# Altium schematic sheet remote_P1.schdoc
size 297 x 209 mm; Symbol: Drawing-Symbol_A4; @Project Name: Sonat_suport_mainboard; @Page Count: 1; @Update Date: 2026-11-01; @Create Date: 2026-11-01; @Schematic Name: Schematic2; @Page No: 1; @Page Name: P1; Company: EasyEDA.com; Version: V1.0; Page Size: A4; Device: Drawing-Symbol_A4; @Create Time: 14:49:21; @Update Time: 14:49:21; Border: 1; Width: 1170; Height: 825; Region Start: 1; X Region Count: 6; Y Region Count: 4; Blade Width: 10; Title Block Position: 3
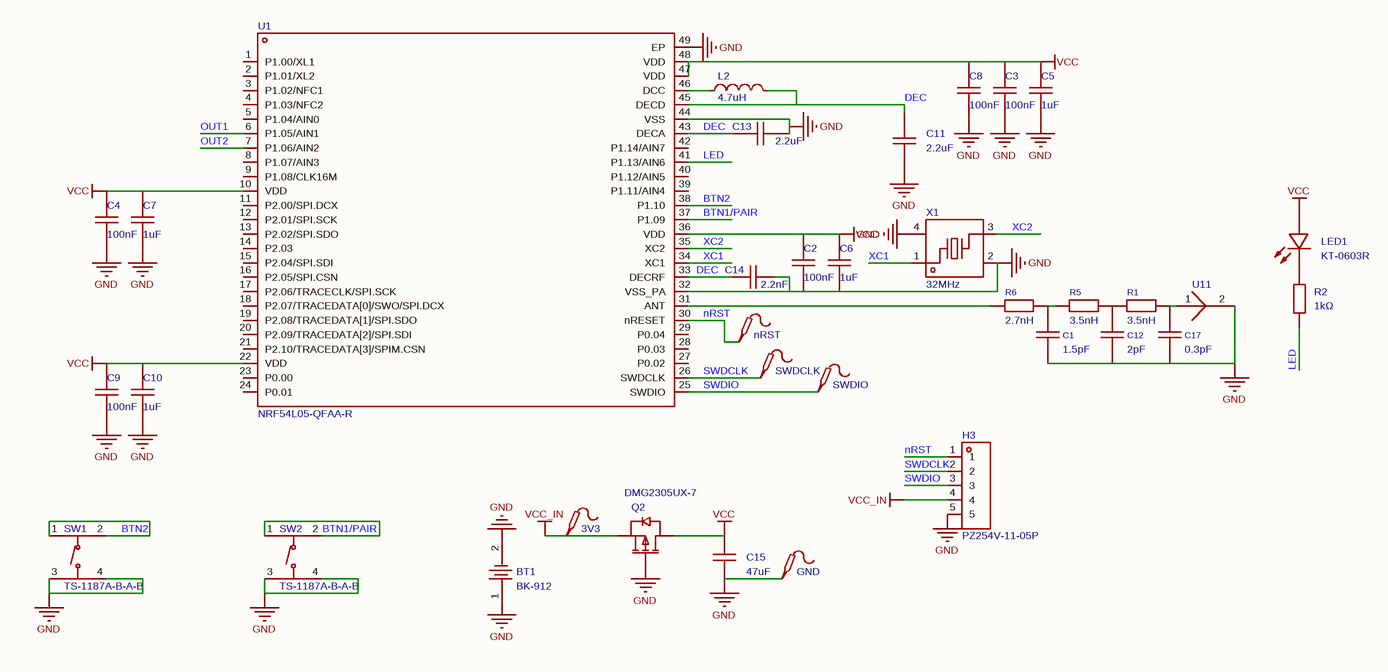
[diagram p0: remote_P1.schdoc]

## Parts
3V3  (no value)  [Test-Point-0.5mm]
BT1  BK-912  [BAT-SMD_BK-912-TR]
C1  1.5pF  [C0402]
C2  100nF  [C0402]
C3  100nF  [C0402]
C4  100nF  [C0402]
C5  1uF  [C0402]
C6  1uF  [C0402]
C7  1uF  [C0402]
C8  100nF  [C0402]
C9  100nF  [C0402]
C10  1uF  [C0402]
C11  2.2uF  [C0402]
C12  2pF  [C0402]
C13  2.2uF  [C0402]
C14  2.2nF  [C0402]
C15  47uF  [C0805]
C17  0.3pF  [C0402]
GND  (no value)  [Test-Point-0.5mm]
H3  PZ254V-11-05P  [HDR-TH_5P-P2.54-V-M]
L2  4.7uH  [L0805]
LED1  KT-0603R  [LED-SMD_L1.6-W0.8-R-RD]
nRST  (no value)  [Test-Point-0.5mm]
Q2  DMG2305UX-7  [SOT-23-3_L2.9-W1.3-P1.90-LS2.4-BR]
R1  3.5nH  [R0402]
R2  1kΩ  [R0402]
R5  3.5nH  [R0402]
R6  2.7nH  [R0402]
SW1  TS-1187A-B-A-B  [SW-SMD_4P-L5.1-W5.1-P3.70-LS6.5-TL_H1.5]
SW2  TS-1187A-B-A-B  [SW-SMD_4P-L5.1-W5.1-P3.70-LS6.5-TL_H1.5]
SWDCLK  (no value)  [Test-Point-0.5mm]
SWDIO  (no value)  [Test-Point-0.5mm]
U1  NRF54L05-QFAA-R  [QFN-48_L6.0-W6.0-P0.40-TL-EP4.6]
U11  (no value)  [Texas_SWRA117D_2.4GHz_Right]
X1  32MHz  [CRYSTAL-SMD_4P-L2.0-W1.6-BL-2]

## Nets
GND: BT1.1 BT1.2 C1.1 C2.1 C3.1 C4.1 C5.1 C6.1 C7.1 C8.1 C9.1 C10.1 C11.1 C12.1 C13.1 C14.2 C15.1 C17.1 GND.1 H3.5 Q2.1(G) SW1.3(C) SW1.4(D) SW2.3(C) SW2.4(D) U1.32(VSS_PA) U1.44(VSS) U1.49(EP) U11.2 X1.2(GND) X1.4(GND)
VCC: C2.2 C3.2 C4.2 C5.2 C6.2 C7.2 C8.2 C9.2 C10.2 C15.2 LED1.1(A) Q2.3(D) U1.10(VDD) U1.22(VDD) U1.36(VDD) U1.47(VDD) U1.48(VDD)
VCC_IN: 3V3.1 H3.4 Q2.2(S)
BTN1/PAIR: SW2.1(A) SW2.2(B) U1.37(P1.09)
BTN2: SW1.1(A) SW1.2(B) U1.38(P1.10)
DEC: C11.2 C13.2 C14.1 L2.2 U1.33(DECRF) U1.43(DECA) U1.45(DECD)
LED: R2.1 U1.41(P1.13/AIN6)
nRST: H3.1 nRST.1 U1.30(nRESET)
OUT1: U1.6(P1.05/AIN1)
OUT2: U1.7(P1.06/AIN2)
SWDCLK: H3.2 SWDCLK.1 U1.26(SWDCLK)
SWDIO: H3.3 SWDIO.1 U1.25(SWDIO)
XC1: U1.34(XC1) X1.1
XC2: U1.35(XC2) X1.3
NetC1_2: C1.2 R5.1 R6.2
NetC12_2: C12.2 R1.1 R5.2
NetC17_2: C17.2 R1.2 U11.1
NetL2_1: L2.1 U1.46(DCC)
NetLED1_2: LED1.2(K) R2.2
NetR6_1: R6.1 U1.31(ANT)

Not connected (* = marked no-connect by the designer): U1 1(P1.00/XL1) 2(P1.01/XL2) 3(P1.02/NFC1) 4(P1.03/NFC2) 5(P1.04/AIN0) 8(P1.07/AIN3) 9(P1.08/CLK16M) 11(P2.00/SPI.DCX) 12(P2.01/SPI.SCK) 13(P2.02/SPI.SDO) 14(P2.03) 15(P2.04/SPI.SDI) 16(P2.05/SPI.CSN) 17(P2.06/TRACECLK/SPI.SCK) 18(P2.07/TRACEDATA[0]/SWO/SPI.DCX) 19(P2.08/TRACEDATA[1]/SPI.SDO) 20(P2.09/TRACEDATA[2]/SPI.SDI) 21(P2.10/TRACEDATA[3]/SPIM.CSN) 23(P0.00) 24(P0.01) 27(P0.02) 28(P0.03) 29(P0.04) 39(P1.11/AIN4) 40(P1.12/AIN5) 42(P1.14/AIN7)

## Notes on the sheet
- Create at
- 2026-11-01
- Schematic
- Board
- Schematic2
- Update at
- Page
- P1
- Drawn
- Reviewed
- Sonat_suport_mainboard
- Version
- V1.0
- Size
- A4
- Page  1  Total  1
- EasyEDA.com

## Library data of the parts
3V3 GND nRST SWDCLK SWDIO = Test-Point: Test Point 测试点; AddInBom: yes; Symbol: Test-Point; Device: Test-Point; ConvertToPcb: yes; FootprintName: Test-Point-0.5mm
BT1 = BK-912: Manufacturer: MPD(Memory Protection Devices); Add into BOM: no; ConvertToPcb: yes; ModelId: 6822e3e2a36e44d0990b2b6a441ccfdd|0819f05c4eef4c71ace90d822a990e87; ModelTransform: 899.9982,606.958,0,0,0,0,0,3.11,0; Symbol: BK-912; Device: BK-912; LCSC Part Name: BK-912; SupplierPart: C5369339; ManufacturerPart: BK-912; Supplier Footprint: -; JLCPCB Part Class: Extended Part; Datasheet: https://item.szlcsc.com/datasheet/BK-912/6212042.html; Supplier: LCSC; FootprintName: BAT-SMD_BK-912-TR; ModelName: BAT-SMD_BK-912-TR
C1 C12 C17 = GRM1555C1H1R2WA01D: Capacitance:1.2pF Voltage Rating:50V Temperature Coefficient:C0G; Manufacturer: muRata(村田); AddInBom: yes; ModelId: b7d13df3e9464d7a99d0651d1a5b4d57|0819f05c4eef4c71ace90d822a990e87; ModelName: C0402_L1.0-W0.5-H0.5; ModelTransform: 39.37,19.685,0,0,0,0,0,0,0; Voltage Rating: 50V; Temperature Coefficient: C0G; Symbol: GRM1555C1H1R2WA01D; Device: GRM1555C1H1R2WA01D; Supplier: LCSC; Manufacturer Part: GRM1555C1H1R2WA01D; JLCPCB Part Class: Extended Part; LCSC Part Name: ±0.05pF 1.2pF 50V; Supplier Footprint: 0402; Datasheet: https://item.szlcsc.com/datasheet/GRM1555C1H1R2WA01D/90101.html; ConvertToPcb: yes; FootprintName: C0402
  C1: Value: 1.5pF
  C12: Value: 2pF
  C17: Value: 0.3pF
C2-C4 C8 C9 = CL05B104KO5NNNC: Capacitance:100nF Tolerance:±10% Tolerance:±10% Voltage Rating:16V Temperature Coefficient:X7R; Manufacturer: SAMSUNG(三星); AddInBom: yes; ModelId: b7d13df3e9464d7a99d0651d1a5b4d57|0819f05c4eef4c71ace90d822a990e87; ModelName: C0402_L1.0-W0.5-H0.5; ModelTransform: 39.37,19.685,0,0,0,0,0,0,0; Tolerance: ±10%; Voltage Rating: 16V; Temperature Coefficient: X7R; Symbol: CL05B104KO5NNNC; Device: CL05B104KO5NNNC; LCSC Part Name: 100nF ±10% 16V; SupplierPart: C1525; ManufacturerPart: CL05B104KO5NNNC; Supplier Footprint: 0402; JLCPCB Part Class: Basic Part; Datasheet: https://item.szlcsc.com/datasheet/CL05B104KO5NNNC/1877.html; Supplier: LCSC; ConvertToPcb: yes; FootprintName: C0402; Value: 100nF
C5-C7 C10 = CL05A105KA5NQNC: Capacitance:1uF Tolerance:±10% Tolerance:±10% Voltage Rating:25V Temperature Coefficient:X5R; Manufacturer: SAMSUNG(三星); AddInBom: yes; ModelId: b7d13df3e9464d7a99d0651d1a5b4d57|0819f05c4eef4c71ace90d822a990e87; ModelName: C0402_L1.0-W0.5-H0.5; ModelTransform: 39.37,19.685,0,0,0,0,0,0,0; Tolerance: ±10%; Voltage Rating: 25V; Temperature Coefficient: X5R; Symbol: CL05A105KA5NQNC; Device: CL05A105KA5NQNC; LCSC Part Name: 1uF ±10% 25V; SupplierPart: C52923; ManufacturerPart: CL05A105KA5NQNC; Supplier Footprint: 0402; JLCPCB Part Class: Basic Part; Datasheet: https://item.szlcsc.com/datasheet/CL05A105KA5NQNC/53938.html; Supplier: LCSC; ConvertToPcb: yes; FootprintName: C0402; Value: 1uF
C11 C13 = CL05A225MQ5NSNC: Capacitance:2.2uF Tolerance:±20% Tolerance:±20% Voltage Rating:6.3V Temperature Coefficient:X5R; Manufacturer: SAMSUNG(三星); AddInBom: yes; ModelId: b7d13df3e9464d7a99d0651d1a5b4d57|0819f05c4eef4c71ace90d822a990e87; ModelName: C0402_L1.0-W0.5-H0.5; ModelTransform: 39.37,19.685,0,0,0,0,0,0,0; Tolerance: ±20%; Voltage Rating: 6.3V; Temperature Coefficient: X5R; Symbol: CL05A225MQ5NSNC; Device: CL05A225MQ5NSNC; LCSC Part Name: 2.2uF ±20% 6.3V; SupplierPart: C12530; ManufacturerPart: CL05A225MQ5NSNC; Supplier Footprint: 0402; JLCPCB Part Class: Basic Part; Datasheet: https://item.szlcsc.com/datasheet/CL05A225MQ5NSNC/13164.html; Supplier: LCSC; ConvertToPcb: yes; FootprintName: C0402; Value: 2.2uF
C14 = 0402B222K500NT: Capacitance:2.2nF Tolerance:±10% Tolerance:±10% Voltage Rating:50V Temperature Coefficient:X7R; Manufacturer: FH(风华); AddInBom: yes; ModelId: b7d13df3e9464d7a99d0651d1a5b4d57|0819f05c4eef4c71ace90d822a990e87; ModelName: C0402_L1.0-W0.5-H0.5; ModelTransform: 39.37,19.685,0,0,0,0,0,0,0; Tolerance: ±10%; Voltage Rating: 50V; Temperature Coefficient: X7R; Symbol: 0402B222K500NT; Device: 0402B222K500NT; LCSC Part Name: 2.2nF ±10% 50V; SupplierPart: C1531; ManufacturerPart: 0402B222K500NT; Supplier Footprint: 0402; JLCPCB Part Class: Extended Part; Datasheet: https://item.szlcsc.com/datasheet/0402B222K500NT/1883.html; Supplier: LCSC; ConvertToPcb: yes; FootprintName: C0402; Value: 2.2nF
C15 = CL21A476MQYNNNE: Capacitance:47uF Tolerance:±20% Tolerance:±20% Voltage Rating:6.3V Temperature Coefficient:X5R; Manufacturer: SAMSUNG(三星); AddInBom: yes; ModelId: 8c88e81f49c6409b980720ec8953afb6|0819f05c4eef4c71ace90d822a990e87; ModelName: C0805_L2.0-W1.3-H1.3; ModelTransform: 78.74,51.181,0,0,0,0,0,0.0005,0; Tolerance: ±20%; Voltage Rating: 6.3V; Temperature Coefficient: X5R; Symbol: CL21A476MQYNNNE; Device: CL21A476MQYNNNE; LCSC Part Name: 47uF ±20% 6.3V; SupplierPart: C16780; ManufacturerPart: CL21A476MQYNNNE; Supplier Footprint: 0805; JLCPCB Part Class: Basic Part; Datasheet: https://item.szlcsc.com/datasheet/CL21A476MQYNNNE/17464.html; Supplier: LCSC; ConvertToPcb: yes; FootprintName: C0805; Value: 47uF
H3 = PZ254V-11-05P: Pin Structure:1x5P Pitch:2.54mm Row Spacing:- Circluar Pins/Square Pins:Square pin Mounting Type:Through Hole Number of Rows:1 Number of Pins:5P Current Rating:3A Voltage Rating (Max):250V Length of Mating Pin:6.1mm Insulation Height:2.5mm Length of End C; Manufacturer: XFCN(兴飞); Add into BOM: no; ConvertToPcb: yes; ModelId: 98c612b43cbb479a86eae3328ff22ecc|0819f05c4eef4c71ace90d822a990e87; ModelName: HDR-TH_5P-P2.54-M-LI-1X5P; ModelTransform: 499.999,100,0,0,0,0,0,0,-118.11; Pin Structure: 1x5P; Pitch: 2.54mm; Current Rating: 3A; Voltage Rating (Max): 250V; Symbol: PZ254V-11-05P; Device: PZ254V-11-05P; LCSC Part Name: 1x5P 间距:2.54mm 方针 直插; SupplierPart: C492404; ManufacturerPart: PZ254V-11-05P; Supplier Footprint: 插件,P=2.54mm; JLCPCB Part Class: Extended Part; Datasheet: https://item.szlcsc.com/datasheet/PZ254V-11-05P/502960.html; Supplier: LCSC; FootprintName: HDR-TH_5P-P2.54-V-M; Row Spacing: -; Circluar Pins/Square Pins: Square pin; Mounting Type: Through Hole; Number of Rows: 1; Number of Pins: 5P; Length of Mating Pin: 6.1mm; Insulation Height: 2.5mm; Length of End Connection Pin: 3mm; Contact Material: Brass; Contact Plating: Gold; Operating Temperature: -40℃~+105℃; Color: Black
L2 = CB2012T4R7M: Inductance:4.7uH Tolerance:±20% Tolerance:±20% Current Rating:580mA Current - Saturation(Isat):300mA DC Resistance(DCR):520mΩ Type:Wire-wound inductor; Manufacturer: TAIYO YUDEN(太诱); AddInBom: yes; ModelId: b83c7c5430874b8eb2319a65d9433429|0819f05c4eef4c71ace90d822a990e87; ModelName: R0805_L2.0-W1.3-H0.6; ModelTransform: 78.74,51.181,0,0,0,0,0,0.001,0; Tolerance: ±20%; Current Rating: 580mA; Current - Saturation(Isat): 300mA; DC Resistance(DCR): 520mΩ; Symbol: CB2012T4R7M; Device: CB2012T4R7M; LCSC Part Name: 4.7uH ±20% 300mA; SupplierPart: C90313; ManufacturerPart: CB2012T4R7M; Supplier Footprint: 0805; JLCPCB Part Class: Extended Part; Datasheet: https://item.szlcsc.com/datasheet/CB2012T4R7M/91499.html; Supplier: LCSC; ConvertToPcb: yes; FootprintName: L0805; Value: 4.7uH; Type: Wire-wound inductor
LED1 = KT-0603R: Lamp Holder Type:1.6mm x 0.8mm square LED Illumination Color:Red Voltage - Forward(Vf):1.8V~2.4V Voltage - Forward(Vf):1.8V~2.4V Power(Watts):40mW Forward Current:20mA Wavelength - Dominant:615nm~630nm Wavelength - Dominant:615nm~630nm Peak Wavelength:645; Manufacturer: KENTO; AddInBom: yes; ModelId: 19cc79473bbc420a8203ad67d1a57d42|0819f05c4eef4c71ace90d822a990e87; ModelName: LED0603_L1.6-W0.8-H0.6; ModelTransform: 63.7794,31.496,0,0,0,0,0,0,0; Illumination Color: Red; Power(Watts): 40mW; Forward Current: 20mA; Peak Wavelength: 645nm; Diode Configuration: Discrete Diode; Lens Color: Water Clear; Luminous Intensity: 300mcd; Viewing Angle: 120°; Symbol: KT-0603R; Device: KT-0603R; LCSC Part Name: 0603 红灯 高亮; SupplierPart: C2286; ManufacturerPart: KT-0603R; Supplier Footprint: 0603; JLCPCB Part Class: Basic Part; Datasheet: https://item.szlcsc.com/datasheet/KT-0603R/2659.html; Supplier: LCSC; ConvertToPcb: yes; FootprintName: LED-SMD_L1.6-W0.8-R-RD; Lamp Holder Type: 1.6mm x 0.8mm square LED; Voltage - Forward(Vf): 1.8V~2.4V; Wavelength - Dominant: 615nm~630nm; Color Temperature: -; Mounting Style: -; Operating Temperature: -40℃~+85℃
Q2 = DMG2305UX-7: Number:1 P-Channel Drain to Source Voltage:20V Current - Continuous Drain(Id):5A RDS(on):52mΩ@4.5V；100mΩ@2.5V Pd - Power Dissipation:1.4W Gate Threshold Voltage (Vgs(th)):900mV Gate Charge(Qg):10.2nC@4.5V Input Capacitance(Ciss):808pF Reverse Transfer Cap; Manufacturer: DIODES(美台); AddInBom: yes; ModelId: 62a57c6760504a01965db6419a6d07df|0819f05c4eef4c71ace90d822a990e87; ModelName: SOT-23-3P_L2.9-W1.3-H1.0-LS2.4-P0.95; ModelTransform: 98.425,114.173,0,180,0,0,0.0005,-0.0005,0; Drain to Source Voltage: 20V; Current - Continuous Drain(Id): 5A; Pd - Power Dissipation: 1.4W; Gate Threshold Voltage (Vgs(th)): 900mV; Input Capacitance(Ciss): 808pF; Reverse Transfer Capacitance (Crss@Vds): 77pF; Output Capacitance(Coss): 85pF; Symbol: DMG2305UX-7; Device: DMG2305UX-7; LCSC Part Name: 1个P沟道 耐压:20V 电流:5A; SupplierPart: C150470; ManufacturerPart: DMG2305UX-7; Supplier Footprint: SOT-23; JLCPCB Part Class: Extended Part; Datasheet: https://item.szlcsc.com/datasheet/DMG2305UX-7/161808.html; Supplier: LCSC; ConvertToPcb: yes; FootprintName: SOT-23-3_L2.9-W1.3-P1.90-LS2.4-BR; Number: 1 P-Channel; RDS(on): 52mΩ@4.5V；100mΩ@2.5V; Gate Charge(Qg): 10.2nC@4.5V; Operating Temperature: -55℃~+150℃; Type: P-Channel
R1 R5 R6 = 0402WGF0000TCE: Type:Thick Film Resistor Resistance:0Ω Tolerance:±1% Tolerance:±1% Power(Watts):62.5mW Voltage-Supply(Max):50V Temperature Coefficient:±800ppm/℃ Temperature Coefficient:±800ppm/℃ Operating Temperature:-55℃~+155℃ Operating Temperature:-55℃~+155℃; Manufacturer: UNI-ROYAL(厚声); AddInBom: yes; ModelId: efdecb7dae4442949d28eecaf748420f|0819f05c4eef4c71ace90d822a990e87; ModelName: R0402_L1.0-W0.5-H0.4; ModelTransform: 39.37,19.685,0,0,0,0,0,0,0; Tolerance: ±1%; Power(Watts): 62.5mW; Voltage-Supply(Max): 50V; Symbol: 0402WGF0000TCE; Device: 0402WGF0000TCE; Supplier: LCSC; Manufacturer Part: 0402WGF0000TCE; JLCPCB Part Class: Basic Part; LCSC Part Name: 厚膜电阻 0Ω ±1%; Supplier Footprint: 0402; Datasheet: https://item.szlcsc.com/datasheet/0402WGF0000TCE/17853.html; ConvertToPcb: yes; FootprintName: R0402; Type: Thick Film Resistor; Temperature Coefficient: ±800ppm/℃; Operating Temperature: -55℃~+155℃
  R1 R5: Value: 3.5nH
  R6: Value: 2.7nH
R2 = 0402WGF1001TCE: Type:Thick Film Resistor Resistance:1kΩ Tolerance:±1% Tolerance:±1% Power(Watts):62.5mW Voltage-Supply(Max):50V Temperature Coefficient:±100ppm/℃ Temperature Coefficient:±100ppm/℃ Operating Temperature:-55℃~+155℃ Operating Temperature:-55℃~+155℃; Manufacturer: UNI-ROYAL(厚声); AddInBom: yes; ModelId: efdecb7dae4442949d28eecaf748420f|0819f05c4eef4c71ace90d822a990e87; ModelName: R0402_L1.0-W0.5-H0.4; ModelTransform: 39.37,19.685,0,0,0,0,0,0,0; Tolerance: ±1%; Power(Watts): 62.5mW; Voltage-Supply(Max): 50V; Symbol: 0402WGF1001TCE; Device: 0402WGF1001TCE; LCSC Part Name: 厚膜电阻 1kΩ ±1%; SupplierPart: C11702; ManufacturerPart: 0402WGF1001TCE; Supplier Footprint: 0402; JLCPCB Part Class: Basic Part; Datasheet: https://item.szlcsc.com/datasheet/0402WGF1001TCE/12256.html; Supplier: LCSC; ConvertToPcb: yes; FootprintName: R0402; Type: Thick Film Resistor; Value: 1kΩ; Temperature Coefficient: ±100ppm/℃; Operating Temperature: -55℃~+155℃
SW1 SW2 = TS-1187A-B-A-B: Circuit:SPST Actuator Style:Round Button Operating Force:1.6N Mounting Type:Surface Mount,Vertical Length:5.1mm Width:5.1mm Switch Height:1.5mm with Bracket:Without Bracket Contact Current:50mA Voltage Rating:12V Actuator/Cap Color:Gold With Lamp:No Life:; Manufacturer: XKB Connection(中国星坤); AddInBom: yes; ModelId: 297e93217c8a461096f3cf9cc3d4db3d|0819f05c4eef4c71ace90d822a990e87; ModelTransform: 255.905,204.76337,0,0,0,0,0,0,0; Circuit: SPST; Operating Force: 1.6N; Switch Height: 1.5mm; Contact Current: 50mA; Voltage Rating: 12V; Actuator/Cap Color: Gold; With Lamp: No; Life: 100,000 cycles; Symbol: TS-1187A-B-A-B; Device: TS-1187A-B-A-B; LCSC Part Name: 5.1*5.1*1.5mm 立贴 轻触开关; SupplierPart: C318884; ManufacturerPart: TS-1187A-B-A-B; Supplier Footprint: SMD-4P,5.1x5.1mm; JLCPCB Part Class: Basic Part; Datasheet: https://item.szlcsc.com/datasheet/TS-1187A-B-A-B/299976.html; Supplier: LCSC; ConvertToPcb: yes; FootprintName: SW-SMD_4P-L5.1-W5.1-P3.70-LS6.5-TL_H1.5; ModelName: SW-SMD_4P-L5.1-W5.1-P3.70-LS6.5-TL_H1.5; Actuator Style: Round Button; Mounting Type: Surface Mount,Vertical; Length: 5.1mm; Width: 5.1mm; with Bracket: Without Bracket; Operating Temperature: -30℃~+85℃
U1 = NRF54L05-QFAA-R: CPU Core:ARM Cortex-M Series CPU Maximum Speed:128MHz Core Size:32 Bit Program Storage Size:500KB Program Memory Type:RAM RAM Size:96KB ADC (Bit):14bit Oscillator Type:Built-in+External Voltage - Supply:1.7V~3.6V Voltage - Supply:1.7V~3.6V Operating Tempe; Manufacturer: NORDIC; AddInBom: yes; ModelId: 1ac2c824fdd9400f99579d676d418037|0819f05c4eef4c71ace90d822a990e87; ModelTransform: 236.22,236.22,0,0,0,0,0,0,0; CPU Maximum Speed: 128MHz; Core Size: 32 Bit; Program Storage Size: 500KB; RAM Size: 96KB; ADC (Bit): 14bit; Symbol: NRF54L05-QFAA-R; Device: NRF54L05-QFAA-R; LCSC Part Name: 超低功耗多协议2.4 GHz无线系统芯片，集成微控制器单元和Arm Cortex-M33处理器; SupplierPart: C45022042; ManufacturerPart: NRF54L05-QFAA-R; Supplier Footprint: VFQFN-48; JLCPCB Part Class: Extended Part; Datasheet: https://item.szlcsc.com/datasheet/NRF54L05-QFAA-R/47110511.html; Supplier: LCSC; ConvertToPcb: yes; FootprintName: QFN-48_L6.0-W6.0-P0.40-TL-EP4.6; ModelName: QFN-48_L6.0-W6.0-P0.40-TL-EP4.6; CPU Core: ARM Cortex-M Series; Program Memory Type: RAM; Oscillator Type: Built-in+External; Voltage - Supply: 1.7V~3.6V; Operating Temperature: -40℃~+105℃; Features: -
U11 = Texas_SWRA117D_2.4GHz_Right: AddInBom: yes; Symbol: Texas_SWRA117D_2.4GHz_Right; Device: Texas_SWRA117D_2.4GHz_Right; ConvertToPcb: yes; FootprintName: Texas_SWRA117D_2.4GHz_Right
X1 = X201632MOB4SI: Type:Crystal Oscillator Frequency:32MHz Normal temperature Frequency Tolerance:±10ppm Normal temperature Frequency Tolerance:±10ppm Load Capacitance:12pF Frequency Stability:±20ppm Frequency Stability:±20ppm Equivalent Series Resistance(ESR):80Ω Operating; Manufacturer: YXC(扬兴晶振); AddInBom: yes; ModelId: 88b2bfffe1bb4b03835469d29dfc2d00|0819f05c4eef4c71ace90d822a990e87; ModelTransform: 78.74,62.992,0,0,0,0,0,0,0; Normal temperature Frequency Tolerance: ±10ppm; Load Capacitance: 12pF; Frequency Stability: ±20ppm; Equivalent Series Resistance(ESR): 80Ω; Symbol: X201632MOB4SI; Device: X201632MOB4SI; LCSC Part Name: YSX211SL 32MHZ 12PF ±10PPM -40~85℃; SupplierPart: C2682773; ManufacturerPart: X201632MOB4SI; Supplier Footprint: SMD2016-4P; JLCPCB Part Class: Extended Part; Datasheet: https://item.szlcsc.com/datasheet/X201632MOB4SI/2777870.html; Supplier: LCSC; ConvertToPcb: yes; FootprintName: CRYSTAL-SMD_4P-L2.0-W1.6-BL-2; ModelName: CRYSTAL-SMD_4P-L2.0-W1.6-BL-2; Type: Crystal Oscillator; Value: 32MHz; Operating Temperature: -40℃~+85℃